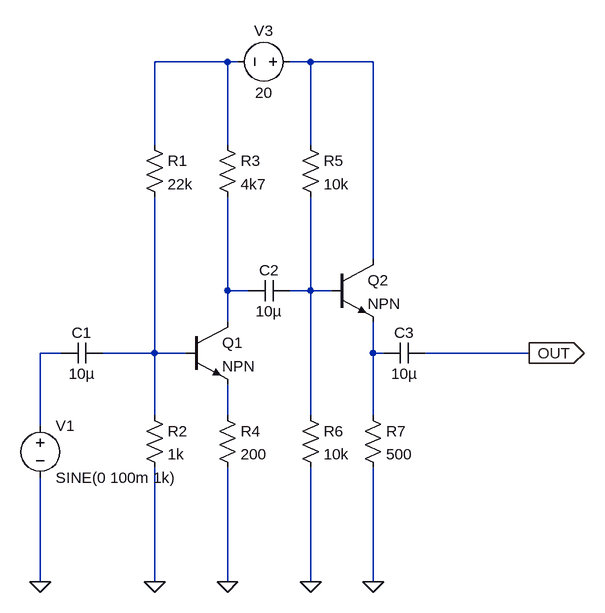
[diagram p0: schematic Draft2.asc]
Draft2.asc, the LTspice schematic file:
Version 4
SHEET 1 1196 680
WIRE 480 -192 368 -192
WIRE 496 -192 480 -192
WIRE 608 -192 576 -192
WIRE 704 -192 608 -192
WIRE 368 -64 368 -192
WIRE 480 -64 480 -192
WIRE 608 -64 608 -192
WIRE 704 112 704 -192
WIRE 480 160 480 16
WIRE 512 160 480 160
WIRE 608 160 608 16
WIRE 608 160 576 160
WIRE 640 160 608 160
WIRE 480 208 480 160
WIRE 224 256 192 256
WIRE 368 256 368 16
WIRE 368 256 288 256
WIRE 416 256 368 256
WIRE 704 256 704 208
WIRE 720 256 704 256
WIRE 944 256 784 256
WIRE 368 352 368 256
WIRE 480 352 480 304
WIRE 608 352 608 160
WIRE 704 352 704 256
WIRE 192 368 192 256
WIRE 192 608 192 448
WIRE 368 608 368 432
WIRE 480 608 480 432
WIRE 608 608 608 432
WIRE 704 608 704 432
FLAG 704 608 0
FLAG 480 608 0
FLAG 368 608 0
FLAG 192 608 0
FLAG 608 608 0
FLAG 944 256 OUT
IOPIN 944 256 Out
SYMBOL voltage 192 352 R0
SYMATTR InstName V1
SYMATTR Value SINE(0 100m 1k)
SYMBOL cap 288 240 R90
WINDOW 0 0 32 VBottom 2
WINDOW 3 32 32 VTop 2
SYMATTR InstName C1
SYMATTR Value 10µ
SYMBOL cap 576 144 R90
WINDOW 0 0 32 VBottom 2
WINDOW 3 32 32 VTop 2
SYMATTR InstName C2
SYMATTR Value 10µ
SYMBOL cap 784 240 R90
WINDOW 0 0 32 VBottom 2
WINDOW 3 32 32 VTop 2
SYMATTR InstName C3
SYMATTR Value 10µ
SYMBOL res 352 -80 R0
SYMATTR InstName R1
SYMATTR Value 22k
SYMBOL res 352 336 R0
SYMATTR InstName R2
SYMATTR Value 1k
SYMBOL res 464 -80 R0
SYMATTR InstName R3
SYMATTR Value 4k7
SYMBOL res 464 336 R0
SYMATTR InstName R4
SYMATTR Value 200
SYMBOL res 592 -80 R0
SYMATTR InstName R5
SYMATTR Value 10k
SYMBOL res 688 336 R0
SYMATTR InstName R7
SYMATTR Value 500
SYMBOL npn 416 208 R0
SYMATTR InstName Q1
SYMBOL res 592 336 R0
SYMATTR InstName R6
SYMATTR Value 10k
SYMBOL npn 640 112 R0
SYMATTR InstName Q2
SYMBOL voltage 592 -192 R90
WINDOW 0 -32 56 VBottom 2
WINDOW 3 32 56 VTop 2
SYMATTR InstName V3
SYMATTR Value 20

The netlist it stands for:
* Draft2.asc
V1 N005 0 SINE(0 100m 1k)
C1 N006 N005 10µ
C2 N004 N003 10µ
C3 OUT N007 10µ
R1 N001 N006 22k
R2 N006 0 1k
R3 N001 N003 4k7
R4 N008 0 200
R5 N002 N004 10k
R7 N007 0 500
Q1 N003 N006 N008 0 NPN
R6 N004 0 10k
Q2 N002 N004 N007 0 NPN
V3 N002 N001 20
.model NPN NPN
.model PNP PNP
.lib standard.bjt
.backanno
.end